# Altium project Wearable_ECG_OptionA.PrjPcb
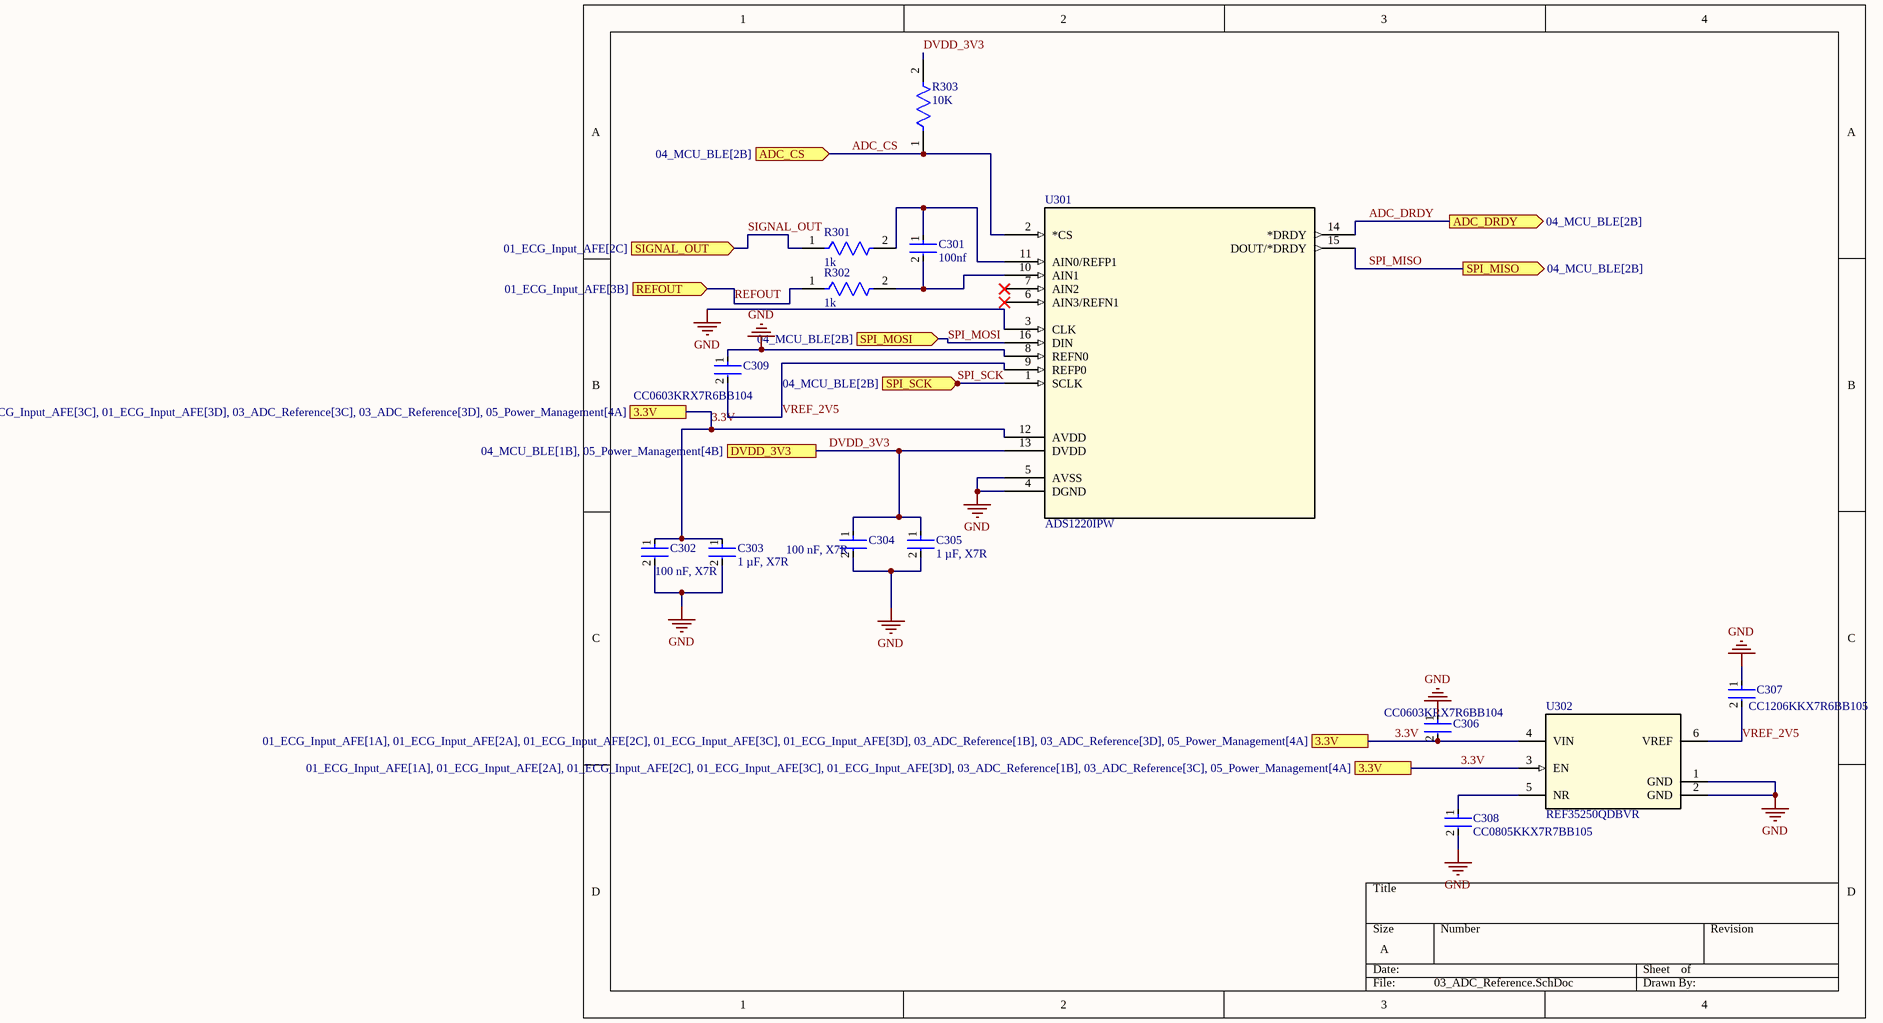
[diagram p0: 03_ADC_Reference.SchDoc]
6 sheets, 68 parts. Net scope: flat (ports and power ports of the same name join across sheets).
Board file: Wearable_ECG_230108U_230507R.PcbDoc
Sheets:
  02_DRL.SchDoc
  03_ADC_Reference.SchDoc
  04_MCU_BLE.SchDoc
  05_Power_Management.SchDoc
  06_System_Overview.SchDoc
  01_ECG_Input_AFE.SchDoc

## Sheet 02_DRL.SchDoc
size A; SheetNumber: 1; SheetTotal: 6

## Sheet 03_ADC_Reference.SchDoc
size A; SheetNumber: 2; SheetTotal: 6

### Parts
C301  100nf  [FP-CC0603-DA-MFG]
C302  100 nF, X7R  [FP-CC0603-DA-MFG]
C303  1 µF, X7R  [FP-CC0805-0_85-MFG]
C304  100 nF, X7R  [FP-CC0603-DA-MFG]
C305  1 µF, X7R  [FP-CC0805-0_85-MFG]
C306  CC0603KRX7R6BB104  [FP-CC0603-DA-MFG]
C307  CC1206KKX7R6BB105  [FP-CC1206-1_25-MFG]
C308  CC0805KKX7R7BB105  [FP-CC0805-0_85-MFG]
C309  CC0603KRX7R6BB104  [FP-CC0603-DA-MFG]
R301  1k  [FP-AC0603-IPC_B]
R302  1k  [FP-AC0603-IPC_B]
R303  10K  [FP-MCT0603-IPC_B]
U301  ADS1220IPW  [PW16]
U302  REF35250QDBVR  [DBV0006A-IPC_A]

### Ports
3.3V (see 01_ECG_Input_AFE[1A], 01_ECG_Input_AFE[2A], 01_ECG_Input_AFE[2C], 01_ECG_Input_AFE[3C], 01_ECG_Input_AFE[3D], 03_ADC_Reference[1B], 03_ADC_Reference[3C], 05_Power_Management[4A]), 3.3V (see 01_ECG_Input_AFE[1A], 01_ECG_Input_AFE[2A], 01_ECG_Input_AFE[2C], 01_ECG_Input_AFE[3C], 01_ECG_Input_AFE[3D], 03_ADC_Reference[1B], 03_ADC_Reference[3D], 05_Power_Management[4A]), 3.3V (see 01_ECG_Input_AFE[1A], 01_ECG_Input_AFE[2A], 01_ECG_Input_AFE[2C], 01_ECG_Input_AFE[3C], 01_ECG_Input_AFE[3D], 03_ADC_Reference[3C], 03_ADC_Reference[3D], 05_Power_Management[4A]), ADC_CS (in, see 04_MCU_BLE[2B]), ADC_DRDY (out, see 04_MCU_BLE[2B]), DVDD_3V3 (see 04_MCU_BLE[1B], 05_Power_Management[4B]), REFOUT (in, see 01_ECG_Input_AFE[3B]), SIGNAL_OUT (in, see 01_ECG_Input_AFE[2C]), SPI_MISO (out, see 04_MCU_BLE[2B]), SPI_MOSI (in, see 04_MCU_BLE[2B]), SPI_SCK (in, see 04_MCU_BLE[2B])

### Nets
GND: C302.2 C303.2 C304.2 C305.2 C306.1 C307.1 C308.2 C309.1 U301.3(CLK) U301.4(DGND) U301.5(AVSS) U301.8(REFN0) U302.1(GND) U302.2(GND)
3.3V: C302.1 C303.1 C306.2 U301.12(AVDD) U302.3(EN) U302.4(VIN) ; port 3.3V
ADC_CS: R303.1 U301.2(*CS) ; port ADC_CS
ADC_DRDY: U301.14(*DRDY) ; port ADC_DRDY
DVDD_3V3: C304.1 C305.1 R303.2 U301.13(DVDD) ; port DVDD_3V3
REFOUT: R302.1 ; port REFOUT
SIGNAL_OUT: R301.1 ; port SIGNAL_OUT
SPI_MISO: U301.15(DOUT/*DRDY) ; port SPI_MISO
SPI_MOSI: U301.16(DIN) ; port SPI_MOSI
SPI_SCK: U301.1(SCLK) ; port SPI_SCK
VREF_2V5: C307.2 C309.2 U301.9(REFP0) U302.6(VREF)
NetC301_1: C301.1 R301.2 U301.11(AIN0/REFP1)
NetC301_2: C301.2 R302.2 U301.10(AIN1)
NetC308_1: C308.1 U302.5(NR)

Not connected (* = marked no-connect by the designer): U301 6(AIN3/REFN1)* 7(AIN2)*

### Library data of the parts
C301 = CMP-03422-001228-1: CAP CER 0.1UF 10V X7R 0603, CC0603KRX7R6BB104; Manufacturer: YAGEO; Material: Ceramic; Tolerance: 0.1; Temperature Coefficient: 15%; Height: 0.9mm; RoHS: TRUE; Footprint Url: http://www.yageo.com/exep/pages/download/literatures/UPY-C_GEN_24.pdf; Octopart: https://octopart.com/cc0603krx7r6bb104-yageo-9291607; Device Class L1: Passive Components; Mouser Description: 0603 0.1 uF 10 V ±10 % Tolerance X7R SMT Multilayer Ceramic Capacitor; ComponentLink2URL: http://www.yageo.com/documents/recent/UPY-GPHC_X7R_6.3V-to-50V_18.pdf; Automotive: No; Voltage: 10 V; Capacitance: 100 nF; Device Class L3: Ceramic Capacitors; Category: Cap; Manufacturer Part Number: CC0603KRX7R6BB104; Temperature: -55°C to +125°C; ComponentLink2Description: Datasheet; Voltage Rating: 10 V; Device Class L2: Capacitors; Lead Free: Yes; Temperature Range High: +125°C; Temperature Range Low: -55°C; Digikey Description: CAP CER 0.1UF 10V X7R 0603; Package: CC0603-DA; Temperature Characteristic: X7R; Value: 100 nF
C302 = CMP-03422-001228-1: CAP CER 0.1UF 10V X7R 0603    CC0603KRX7R6BB104; Manufacturer: YAGEO; Material: Ceramic; Tolerance: 0.1; Capacitance: 100 nF; Temperature Coefficient: 15%; Value: 100 nF; Height: 0.9mm; RoHS: TRUE; Footprint Url: http://www.yageo.com/exep/pages/download/literatures/UPY-C_GEN_24.pdf; Octopart: https://octopart.com/cc0603krx7r6bb104-yageo-9291607; Device Class L1: Passive Components; Mouser Description: 0603 0.1 uF 10 V ±10 % Tolerance X7R SMT Multilayer Ceramic Capacitor; ComponentLink2URL: http://www.yageo.com/documents/recent/UPY-GPHC_X7R_6.3V-to-50V_18.pdf; Automotive: No; Voltage: 10 V; Device Class L3: Ceramic Capacitors; Category: Cap; Manufacturer Part Number: CC0603KRX7R6BB104; Temperature: -55°C to +125°C; ComponentLink2Description: Datasheet; Voltage Rating: 10 V; Device Class L2: Capacitors; Lead Free: Yes; Temperature Range High: +125°C; Temperature Range Low: -55°C; Digikey Description: CAP CER 0.1UF 10V X7R 0603; Package: CC0603-DA; Temperature Characteristic: X7R
C303 C305 = CMP-03422-000373-1: CC0805 1 uF X7R 10.00% 25 V, CC0805KFX7R8BB105; Manufacturer: Yageo; Voltage Rating: 25 V; Value: 1 uF; Tolerance: 0.1; Material: Ceramic; Category: Cap; Footprint Url: http://www.yageo.com/exep/pages/download/literatures/UPY-C_GEN_24.pdf; ComponentLink2Description: Datasheet; Temperature Characteristic: X7R; Temperature Range High: +85°C; Manufacturer Part Number: CC0805KFX7R8BB105; Mouser Description: CC Series 0805 1 uF 25 V ±10% Tolerance X7R Multilayer Ceramic Capacitor; Package: CC0805-0.85; Device Class L1: Passive Components; Automotive: No; RoHS: TRUE; Octopart: https://octopart.com/cc0805kfx7r8bb105-yageo-33242303; Capacitance: 1 uF; Device Class L2: Capacitors; Ipc Land Pattern Name: CAPC200125X85; Temperature Range Low: -30°C; Temperature: -30°C to +85°C; Height: 0.95mm; ComponentLink2URL: http://www.yageo.com/documents/recent/UPY-GPHC_Y5V_6.3V-to-50V_8.pdf; Device Class L3: Ceramic Capacitors; Lead Free: Yes
C304 = CMP-03422-001228-1: CAP CER 0.1UF 10V X7R 0603, CC0603KRX7R6BB104; Manufacturer: YAGEO; Material: Ceramic; Tolerance: 0.1; Capacitance: 100 nF; Temperature Coefficient: 15%; Value: 100 nF; Height: 0.9mm; RoHS: TRUE; Footprint Url: http://www.yageo.com/exep/pages/download/literatures/UPY-C_GEN_24.pdf; Octopart: https://octopart.com/cc0603krx7r6bb104-yageo-9291607; Device Class L1: Passive Components; Mouser Description: 0603 0.1 uF 10 V ±10 % Tolerance X7R SMT Multilayer Ceramic Capacitor; ComponentLink2URL: http://www.yageo.com/documents/recent/UPY-GPHC_X7R_6.3V-to-50V_18.pdf; Automotive: No; Voltage: 10 V; Device Class L3: Ceramic Capacitors; Category: Cap; Manufacturer Part Number: CC0603KRX7R6BB104; Temperature: -55°C to +125°C; ComponentLink2Description: Datasheet; Voltage Rating: 10 V; Device Class L2: Capacitors; Lead Free: Yes; Temperature Range High: +125°C; Temperature Range Low: -55°C; Digikey Description: CAP CER 0.1UF 10V X7R 0603; Package: CC0603-DA; Temperature Characteristic: X7R
C306 C309 = CMP-03422-001228-1: CAP CER 0.1UF 10V X7R 0603; Manufacturer: YAGEO; Material: Ceramic; Tolerance: 0.1; Capacitance: 100 nF; Temperature Coefficient: 15%; Value: 100 nF; Height: 0.9mm; RoHS: TRUE; Footprint Url: http://www.yageo.com/exep/pages/download/literatures/UPY-C_GEN_24.pdf; Octopart: https://octopart.com/cc0603krx7r6bb104-yageo-9291607; Device Class L1: Passive Components; Mouser Description: 0603 0.1 uF 10 V ±10 % Tolerance X7R SMT Multilayer Ceramic Capacitor; ComponentLink2URL: http://www.yageo.com/documents/recent/UPY-GPHC_X7R_6.3V-to-50V_18.pdf; Automotive: No; Voltage: 10 V; Device Class L3: Ceramic Capacitors; Category: Cap; Manufacturer Part Number: CC0603KRX7R6BB104; Temperature: -55°C to +125°C; ComponentLink2Description: Datasheet; Voltage Rating: 10 V; Device Class L2: Capacitors; Lead Free: Yes; Temperature Range High: +125°C; Temperature Range Low: -55°C; Digikey Description: CAP CER 0.1UF 10V X7R 0603; Package: CC0603-DA; Temperature Characteristic: X7R
C307 = CMP-03422-001171-1: CAP CER 1UF 10V X7R 1206; Manufacturer: Yageo; Material: Ceramic; Tolerance: 0.1; Automotive Grade: NA; Temperature Coefficient: 15%; Category: Cap; Package: CC1206-1.25; Device Class L3: Ceramic Capacitors; Footprint Url: http://www.yageo.com/exep/pages/download/literatures/UPY-C_GEN_24.pdf; Octopart: https://octopart.com/cc1206kkx7r6bb105-yageo-21769912; Temperature Range High: +125°C; Lead Free: Yes; Capacitance: 1 uF; Voltage Rating: 10 V; ComponentLink2Description: Datasheet; ComponentLink2URL: http://www.yageo.com/documents/recent/UPY-NP0X7R_HV_1KV-to-3KV_11.pdf; Height: 1.45mm; Device Class L1: Passive Components; Temperature Range Low: -55°C; Value: 1 uF; Device Class L2: Capacitors; Digikey Description: CAP CER 1UF 10V X7R 1206; RoHS: TRUE; Mouser Description: Multilayer Ceramic Capacitors MLCC - SMD/SMT 1.0uF 10V X7R 10%; Temperature Characteristic: X7R; Automotive: No; Temperature: -55°C to +125°C; Manufacturer Part Number: CC1206KKX7R6BB105
C308 = CMP-03422-000001-1: CAP CER 1UF 16V X7R 0805; Manufacturer: Yageo; Material: Ceramic; Tolerance: 0.1; Voltage Rating: 16 V; Category: Cap; Capacitance: 1 uF; ComponentLink2Description: Datasheet; Automotive: No; Temperature Range High: +85°C; RoHS: TRUE; Footprint Url: http://www.yageo.com/exep/pages/download/literatures/UPY-C_GEN_24.pdf; Mouser Description: Multilayer Ceramic Capacitors MLCC - SMD/SMT 1.0uF 16V X7R 10%; Height: 0.95mm; Ipc Land Pattern Name: CAPC200125X85; Temperature: -30°C to +85°C; Lead Free: Yes; Value: 1 uF; Temperature Characteristic: X7R; Package: CC0805-0.85; Temperature Range Low: -30°C; Device Class L1: Passive Components; Device Class L3: Ceramic Capacitors; Octopart: https://octopart.com/cc0805kkx7r7bb105-yageo-8376555; Manufacturer Part Number: CC0805KKX7R7BB105; ComponentLink2URL: http://www.yageo.com/documents/recent/UPY-GPHC_Y5V_6.3V-to-50V_8.pdf; Device Class L2: Capacitors; Digikey Description: CAP CER 1UF 16V X7R 0805
R301 R302 = CMP-03412-047577-1: RES 1kΩ 1.00% 0.2W 0603, AC0603FR-7W1KL
R303 = CMP-02407-001090-1: RES SMD 10K OHM 1% 1/8W 0603, MCT0603HC1002FP500
U301 = ADS1220IPW: 24-bit, 2-kSPS, four-channel, low-power, delta-sigma ADC with PGA, VREF, SPI and two IDACs 16-TSSOP -40 to 125; Manufacturer_Name: Texas Instruments; Copyright: Copyright (C) 2026 Ultra Librarian. All rights reserved.; Manufacturer_Part_Number: ADS1220IPW; Datasheet: https://www.ti.com/lit/gpn/ads1220; RefDes: RefDes; Type: Type
U302 = REF35250QDBVR: 650-nA quiescent current, 12-ppm/Â°C drift, ultra-low-power precision voltage reference 6-SOT-23 -40 to 125; Manufacturer_Name: Texas Instruments; TYPE: TYPE; RefDes: RefDes; Copyright: Copyright (C) 2026 Ultra Librarian. All rights reserved.; Manufacturer_Part_Number: REF35250QDBVR; Datasheet: https://www.ti.com/lit/gpn/ref35

## Sheet 04_MCU_BLE.SchDoc
size A; SheetNumber: 3; SheetTotal: 6
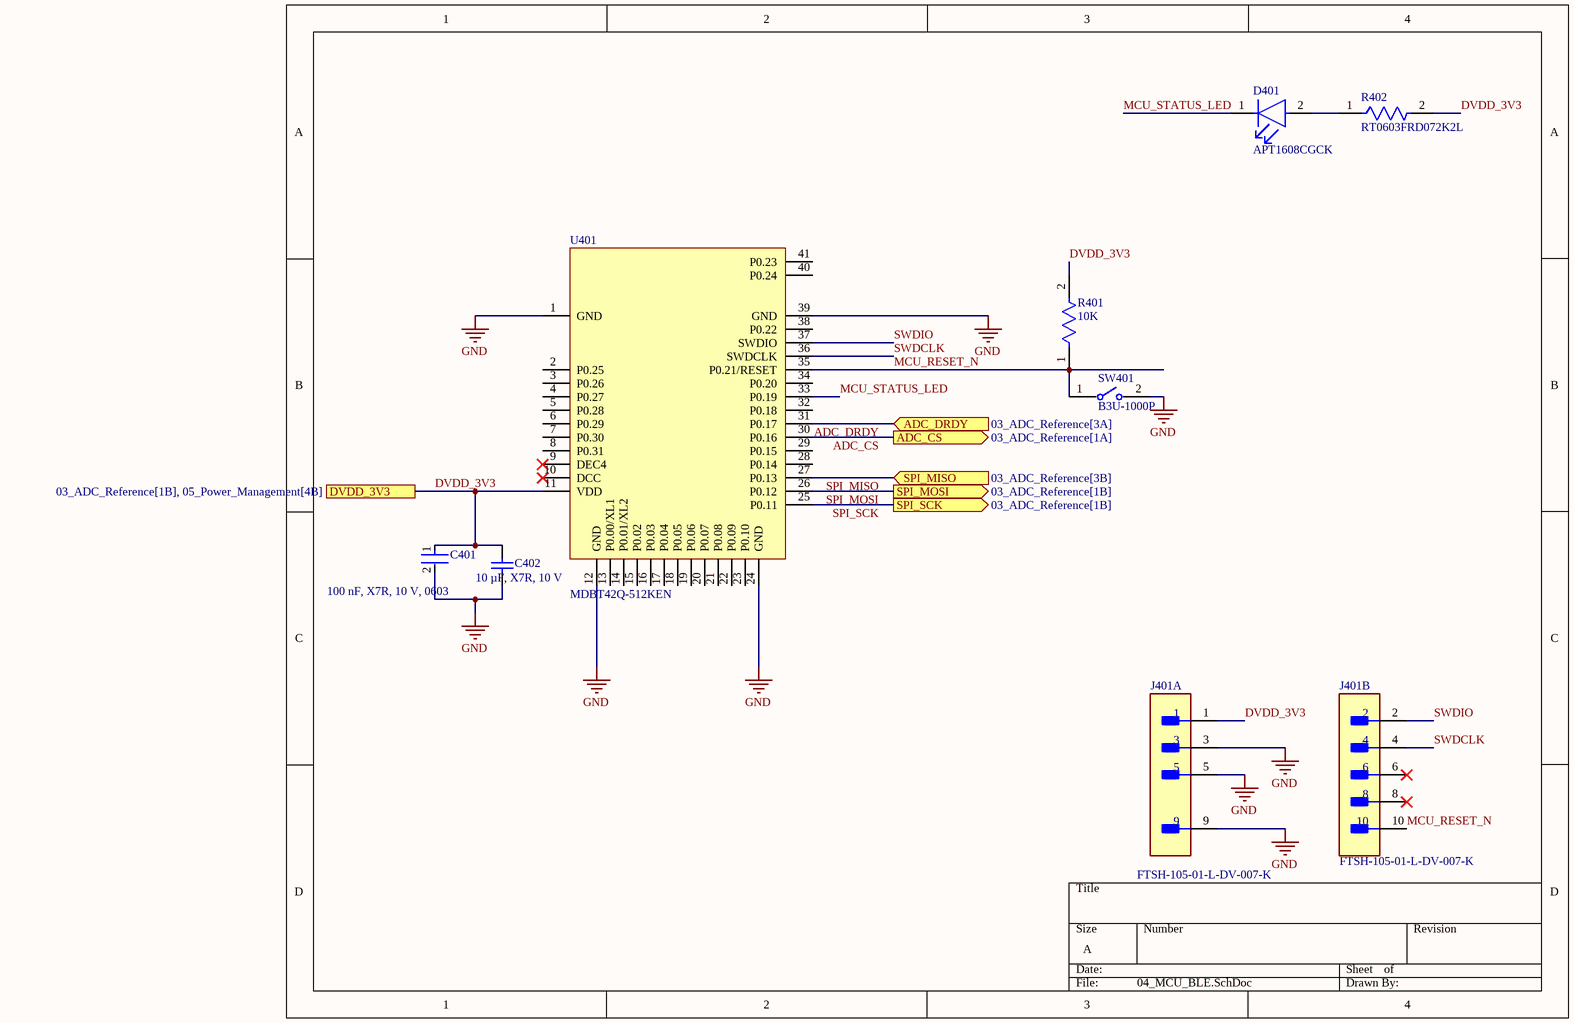
[diagram p1: 04_MCU_BLE.SchDoc]

### Parts
C401  100 nF, X7R, 10 V, 0603  [FP-CC0603-DA-MFG]
C402  10 µF, X7R, 10 V  [CAPC1206(3216)190_N]
D401  APT1608CGCK  [FP-APT1608CGCK-MFG]
J401  FTSH-105-01-L-DV-007-K  [FP-FTSH-105-01-L-DV-007-K-MFG]  (parts A,B of 2)
R401  10K  [FP-AC0603-IPC_C]
R402  RT0603FRD072K2L  [FP-RT0603-MFG]
SW401  B3U-1000P  [FP-B3U-1000P-MFG]
U401  MDBT42Q-512KEN  [MDBT42Q]

### Ports
ADC_CS (out, see 03_ADC_Reference[1A]), ADC_DRDY (in, see 03_ADC_Reference[3A]), DVDD_3V3 (see 03_ADC_Reference[1B], 05_Power_Management[4B]), SPI_MISO (in, see 03_ADC_Reference[3B]), SPI_MOSI (out, see 03_ADC_Reference[1B]), SPI_SCK (out, see 03_ADC_Reference[1B])

### Nets
GND: C401.2 C402.1 J401.3 J401.5 J401.9 SW401.2 U401.1(GND) U401.12(GND) U401.24(GND) U401.39(GND)
ADC_CS: U401.30(P0.16) ; port ADC_CS
ADC_DRDY: U401.31(P0.17) ; port ADC_DRDY
DVDD_3V3: C401.1 C402.2 J401.1 R401.2 R402.2 U401.11(VDD) ; port DVDD_3V3
MCU_RESET_N: J401.10 R401.1 SW401.1 U401.35(P0.21/RESET)
MCU_STATUS_LED: D401.1(C) U401.33(P0.19)
SPI_MISO: U401.27(P0.13) ; port SPI_MISO
SPI_MOSI: U401.26(P0.12) ; port SPI_MOSI
SPI_SCK: U401.25(P0.11) ; port SPI_SCK
SWDCLK: J401.4 U401.36(SWDCLK)
SWDIO: J401.2 U401.37(SWDIO)
NetD401_2: D401.2(A) R402.1

Not connected (* = marked no-connect by the designer): J401 6* 8*; U401 2(P0.25) 3(P0.26) 4(P0.27) 5(P0.28) 6(P0.29) 7(P0.30) 8(P0.31) 9(DEC4)* 10(DCC)* 13(P0.00/XL1) 14(P0.01/XL2) 15(P0.02) 16(P0.03) 17(P0.04) 18(P0.05) 19(P0.06) 20(P0.07) 21(P0.08) 22(P0.09) 23(P0.10) 28(P0.14) 29(P0.15) 32(P0.18) 34(P0.20) 38(P0.22) 40(P0.24) 41(P0.23)

### Library data of the parts
C401 = CMP-03422-001228-1: CAP CER 0.1UF 10V X7R 0603; Manufacturer Part Number: CC0603KRX7R6BB104; Manufacturer: YAGEO; Material: Ceramic; Tolerance: 0.1; Capacitance: 100 nF; Temperature Coefficient: 15%; Value: 100 nF; Height: 0.9mm; RoHS: TRUE; Footprint Url: http://www.yageo.com/exep/pages/download/literatures/UPY-C_GEN_24.pdf; Octopart: https://octopart.com/cc0603krx7r6bb104-yageo-9291607; Device Class L1: Passive Components; Mouser Description: 0603 0.1 uF 10 V ±10 % Tolerance X7R SMT Multilayer Ceramic Capacitor; ComponentLink2URL: http://www.yageo.com/documents/recent/UPY-GPHC_X7R_6.3V-to-50V_18.pdf; Automotive: No; Voltage: 10 V; Device Class L3: Ceramic Capacitors; Category: Cap; Temperature: -55°C to +125°C; ComponentLink2Description: Datasheet; Voltage Rating: 10 V; Device Class L2: Capacitors; Lead Free: Yes; Temperature Range High: +125°C; Temperature Range Low: -55°C; Digikey Description: CAP CER 0.1UF 10V X7R 0603; Package: CC0603-DA; Temperature Characteristic: X7R
C402 = CMP-1037-04966-1: CAP 10uF 10V ±5% 1206 (3216 Metric) Thickness 1.9mm SMD; Case-Metric: 3216; Case-EIA: 1206; Tolerance: Â±5%; Max Thickness: 1.9 mm; Value: 10uF; Rated Voltage: 10 V; Technology: SMT
D401 = CMP-44529-000032-1: LED GREEN CLEAR CHIP SMD; Luminous Intensity: 50mcd; Voltage: 3V; Forward Voltage: 2.1V; Forward Current: 20mA; Dominant Wavelength: 570nm; Power Rating: 75mW; Number of LEDs: 1; Viewing Angle: 120°; Number of Pins: 2; Packaging: Tape and Reel; Min Operating Temperature: -40°C; Length: 1.6mm; Width: 0.8mm; Mount: Surface Mount; Case/Package: 0603; Lead Free: Lead Free; Lens Color: Clear; Lens Style: Clear; Illumination Color: Green; Case Code (Imperial): 0603; Max Operating Temperature: 85°C; Height: 0.75mm; Case Code (Metric): 1608; Color: Green; Package Quantity: 2000; Test Current: 20mA
J401 = CMP-02766-000093-1: CONN HEADER SMD 10POS 1.27MM; Manufacturer: Samtec; Number Of Contacts: 9; Standoff Height: 0.2mm; Current Rating: 3.4A; Conn Orientation: Vertical; Conn Gender: Male; Device Class L3: unset; Manufacturer Part Number: FTSH-105-01-L-DV-007-K; Mouser Description: Conn Unshrouded Header HDR 10 POS 1.27mm Solder ST SMD Tube; Height: 6.38mm; RoHS: TRUE; Number Of Rows: 2; Footprint Url: http://suddendocs.samtec.com/prints/ftsh-1xx-xx-xxx-dv-xxx-footprint.pdf; Lead Free: Yes; Package: 0; Category: Conn; ComponentLink2URL: http://suddendocs.samtec.com/catalog_english/ftsh_smt.pdf; Automotive: No; ComponentLink2Description: Datasheet; Device Class L1: Connectors; Temperature: -55°C to +125°C; Digikey Description: CONN HEADER SMD 10POS 1.27MM; Device Class L2: Headers and Wire Housings; Temperature Range High: +125°C; Octopart: https://octopart.com/ftsh-105-01-l-dv-007-k-samtec-53647300; Contact Material: Gold,Nickel; Temperature Range Low: -55°C; Pitch: 1.27mm
R401 = CMP-03412-008483-2: RES 10KΩ 1.00% 0.1W 0603, AC0603FR-1310KL; Resistance: 10kR; Tolerance: 1%; RoHS Compliant: Yes; Lead Free: Lead Free; Case/Package: 0603
R402 = CMP-03412-026926-1: RES SMD 2.2K OHM 1% 1/10W 0603; Manufacturer: Yageo; Resistance: 2.2KΩ; Tolerance: 0.01; Power Rating: 0.1W; Voltage Rating: 75V; Value: 2.2KΩ; Temperature Coefficient: 25 ppm/°C; Footprint Url: http://www.yageo.com/exep/pages/download/literatures/PYu-R_Mount_10.pdf; ComponentLink2URL: http://www.yageo.com/documents/recent/PYu-RT_1-to-0.01_RoHS_L_9.pdf; Package: RT0603; Temperature: -55°C to +155°C; ComponentLink2Description: Datasheet; Device Class L2: Resistors; Digikey Description: RES SMD 2.2K OHM 1% 1/10W 0603; Composition: Thin Film; Temperature Range High: +155°C; Automotive: No; Temperature Range Low: -55°C; Manufacturer Part Number: RT0603FRD072K2L; Series: RT; RoHS: TRUE; Octopart: https://octopart.com/rt0603frd072k2l-yageo-71395345; Device Class L1: Passive Components; Ipc Land Pattern Name: RESC16080X45; Lead Free: Yes; Height: 0.55mm; Device Class L3: Chip SMD Resistors; Category: Res
SW401 = CMP-2100-03586-2: SWITCH TACTILE SPST-NO 0.05A 12V; Contact Resistance: 100mR; Operating Force: 1.5N; Max Current Rating: 50mA; Switch Travel: 0.15mm; Actuator Type: Standard; Mechanical Life: 200000Cycles; Ratings: Dust Proof; Illumination Type: Non-Illuminated; Throw Configuration: SPST; Actuator Length: 0.4mm; Switch Function: Off-Mom; Height: 1.2mm; Width: 3mm; Weight: 0.000776oz; Contact Material: Silver; Max Voltage Rating (DC): 12V; Insulation Resistance: 100MR; Lead Free: Lead Free; Current Rating: 50mA; Termination: SMD/SMT; Length: 4mm; Voltage Rating (DC): 12V; Contact Current Rating: 50mA; Orientation: Straight; Depth: 2.5mm; Max Operating Temperature: 70°C; Packaging: Tape and Reel; Min Operating Temperature: -25°C; Package Quantity: 1; Mount: Surface Mount; Electrical Life: 200000Cycles
U401 = MDBT42Q

## Sheet 05_Power_Management.SchDoc
size A; SheetNumber: 4; SheetTotal: 6
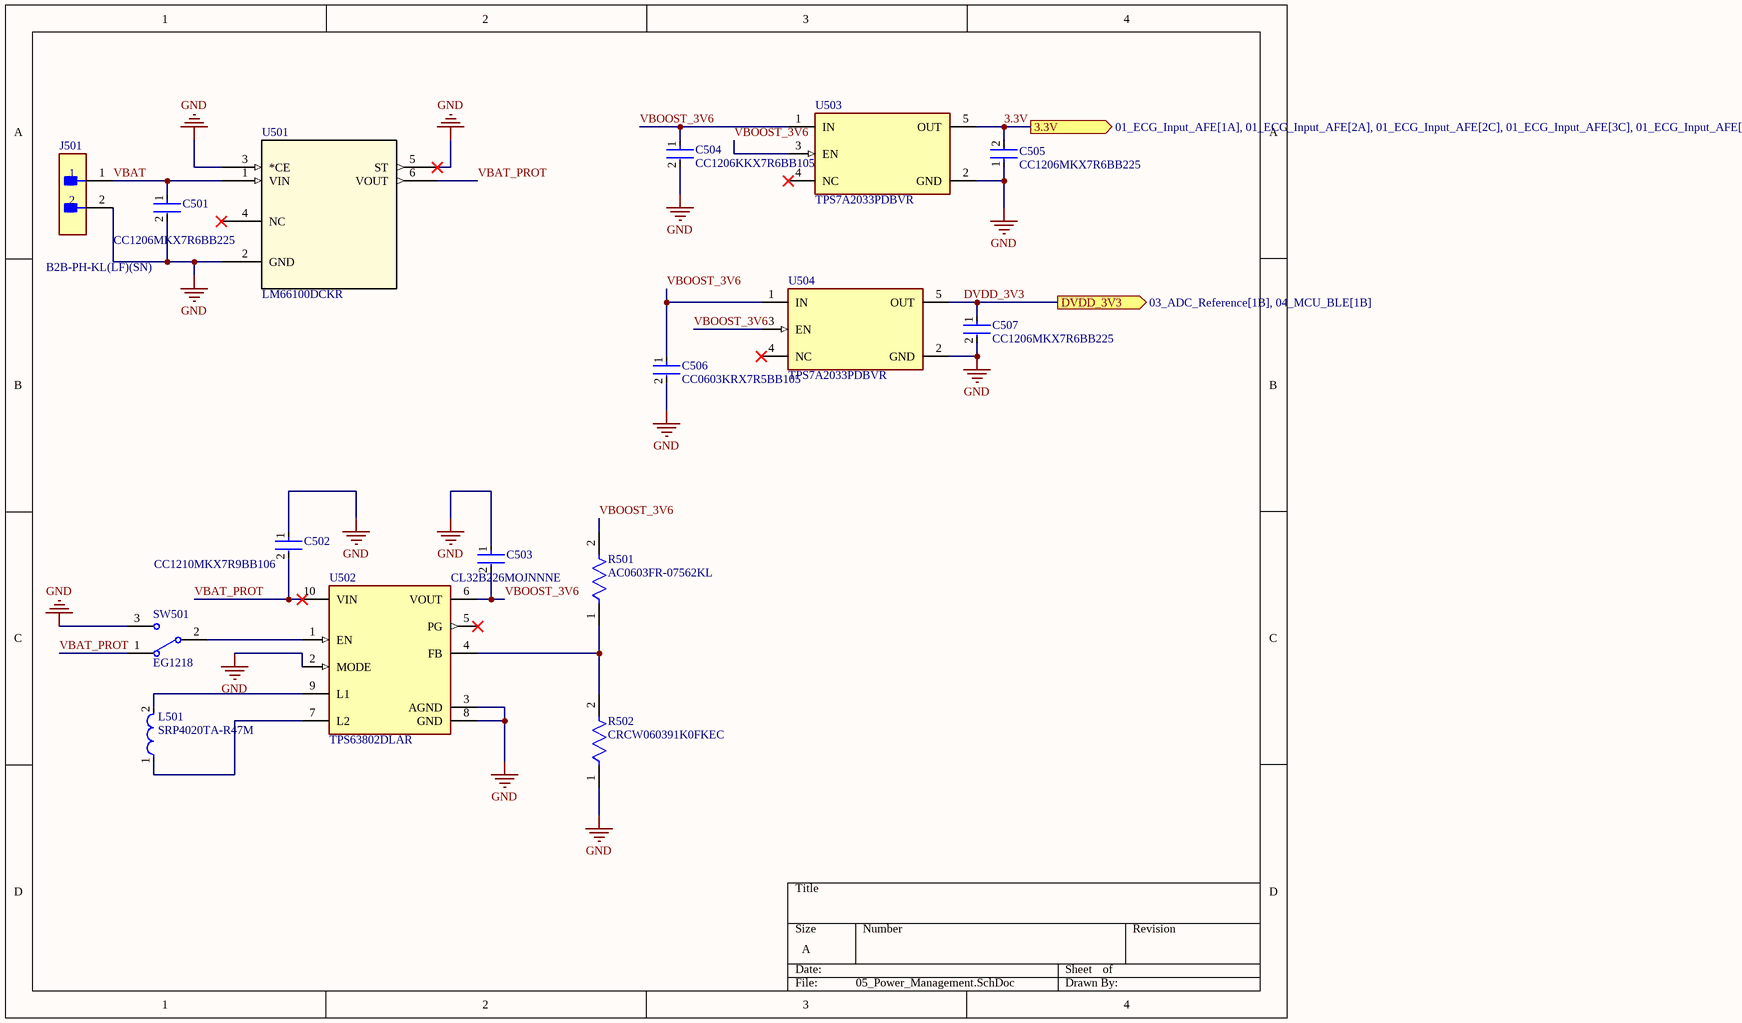
[diagram p2: 05_Power_Management.SchDoc]

### Parts
C501  CC1206MKX7R6BB225  [FP-CC1206-1_25-MFG]
C502  CC1210MKX7R9BB106  [FP-CC1210-GD-MFG]
C503  CL32B226MOJNNNE  [FP-CL32-IPC_A]
C504  CC1206KKX7R6BB105  [FP-CC1206-1_25-MFG]
C505  CC1206MKX7R6BB225  [FP-CC1206-1_25-MFG]
C506  CC0603KRX7R5BB105  [FP-CC0603-DA-MFG]
C507  CC1206MKX7R6BB225  [FP-CC1206-1_25-MFG]
J501  B2B-PH-KL(LF)(SN)  [FP-B2B-PH-KL_LF_SN-MFG]
L501  SRP4020TA-R47M  [FP-SRP4020TA-MFG]
R501  AC0603FR-07562KL  [FP-AC0603-MFG]
R502  CRCW060391K0FKEC  [FP-CRCW0603-e3-MFG]
SW501  EG1218  [ESWI-EG1218_V]
U501  LM66100DCKR  [DCK6_TEX]
U502  TPS63802DLAR  [FP-DLA0010A-MFG]
U503  TPS7A2033PDBVR  [FP-DBV0005A-MFG]
U504  TPS7A2033PDBVR  [FP-DBV0005A-MFG]

### Ports
3.3V (out, see 01_ECG_Input_AFE[1A], 01_ECG_Input_AFE[2A], 01_ECG_Input_AFE[2C], 01_ECG_Input_AFE[3C], 01_ECG_Input_AFE[3D], 03_ADC_Reference[1B], 03_ADC_Reference[3C], 03_ADC_Reference[3D]), DVDD_3V3 (out, see 03_ADC_Reference[1B], 04_MCU_BLE[1B])

### Nets
GND: C501.2 C502.1 C503.1 C504.2 C505.1 C506.2 C507.2 J501.2 R502.1 SW501.3 U501.2(GND) U501.3(*CE) U501.5(ST) U502.2(MODE) U502.3(AGND) U502.8(GND) U503.2(GND) U504.2(GND)
3.3V: C505.2 U503.5(OUT) ; port 3.3V
DVDD_3V3: C507.1 U504.5(OUT) ; port DVDD_3V3
VBAT: C501.1 J501.1 U501.1(VIN)
VBAT_PROT: C502.2 SW501.1 U501.6(VOUT) U502.10(VIN)
VBOOST_3V6: C503.2 C504.1 C506.1 R501.2 U502.6(VOUT) U503.1(IN) U503.3(EN) U504.1(IN) U504.3(EN)
NetL501_1: L501.1 U502.7(L2)
NetL501_2: L501.2 U502.9(L1)
NetR501_1: R501.1 R502.2 U502.4(FB)
NetSW501_2: SW501.2(COM) U502.1(EN)

Not connected (* = marked no-connect by the designer): U501 4(NC)*; U502 5(PG)*; U503 4(NC)*; U504 4(NC)*

### Library data of the parts
C501 C505 C507 = CMP-03422-000380-2: CAP CER 2.2UF 10V X7R 1206; Manufacturer: Yageo; Temperature Coefficient: 15%; Automotive Grade: NA; Tolerance: 0.2; Material: Ceramic; Lead Free: Yes; Temperature Characteristic: X7R; Footprint Url: http://www.yageo.com/exep/pages/download/literatures/UPY-C_GEN_24.pdf; Octopart: https://octopart.com/cc1206mkx7r6bb225-yageo-57080790; Temperature: -55°C to +125°C; Voltage Rating: 10 V; ComponentLink2Description: Datasheet; Device Class L3: Ceramic Capacitors; Manufacturer Part Number: CC1206MKX7R6BB225; Automotive: No; Value: 2.2 uF; Digikey Description: CAP CER 2.2UF 10V X7R 1206; Package: CC1206-1.25; Device Class L2: Capacitors; Category: Cap; Device Class L1: Passive Components; RoHS: TRUE; Height: 1.45mm; ComponentLink2URL: http://www.yageo.com/documents/recent/UPY-NP0X7R_HV_1KV-to-3KV_11.pdf; Capacitance: 2.2 uF; Temperature Range High: +125°C; Temperature Range Low: -55°C
C502 = CMP-03422-001447-1: CAP CER 10UF 50V X7R 1210; Tolerance: 20%; Case/Package: 1210; Max Operating Temperature: 125°C; Case Code (Imperial): 1210; Voltage Rating: 50V; Mount: Surface Mount; Packaging: Tape and Reel; Min Operating Temperature: -55°C; Case Code (Metric): 3225; Capacitance: 10uF; RoHS Compliant: Yes
C503 = CMP-13271-003818-1: Cap Ceramic 22uF 16V X7R ±20% SMD 1210 +125°C Embossed T/R; Mount: Surface Mount; Case/Package: 1210; Case Code (Imperial): 1210; Depth: 2.5mm; Packaging: Tape and Reel; Case Code (Metric): 3225; Package Quantity: 1; Min Operating Temperature: -55°C; Dielectric: X7R; Height: 2.5mm; Length: 3.2mm; Max Operating Temperature: 125°C; Thickness: 0.106inch; Capacitance: 22uF; Width: 0.098inch; Tolerance: 20%; Voltage Rating: 16V; Radiation Hardening: No
C504 = CMP-03422-001171-1: as C307 on sheet 03_ADC_Reference; Category: Cap; Package: CC1206-1.25; Device Class L3: Ceramic Capacitors; Footprint Url: http://www.yageo.com/exep/pages/download/literatures/UPY-C_GEN_24.pdf; Octopart: https://octopart.com/cc1206kkx7r6bb105-yageo-21769912; Temperature Range High: +125°C; Lead Free: Yes; Capacitance: 1 uF; Voltage Rating: 10 V; ComponentLink2Description: Datasheet; ComponentLink2URL: http://www.yageo.com/documents/recent/UPY-NP0X7R_HV_1KV-to-3KV_11.pdf; Height: 1.45mm; Device Class L1: Passive Components; Temperature Range Low: -55°C; Value: 1 uF; Device Class L2: Capacitors; Digikey Description: CAP CER 1UF 10V X7R 1206; RoHS: TRUE; Mouser Description: Multilayer Ceramic Capacitors MLCC - SMD/SMT 1.0uF 10V X7R 10%; Temperature Characteristic: X7R; Automotive: No; Temperature: -55°C to +125°C; Manufacturer Part Number: CC1206KKX7R6BB105
C506 = CMP-03422-000406-1: 0603 1 uF 6.3 V ±10 % Tolerance X7R SMT Multilayer Ceramic Capacitor; Manufacturer: YAGEO; Tolerance: 0.1; Temperature Coefficient: 15%; Capacitance: 1 uF; Value: 1 uF; Voltage Rating: 6.3 V; Temperature Range High: +125°C; Octopart: https://octopart.com/cc0603krx7r5bb105-yageo-11543596; Device Class L2: Capacitors; Package: CC0603-DA; RoHS: TRUE; Digikey Description: 0603 1 uF 6.3 V ±10 % Tolerance X7R SMT Multilayer Ceramic Capacitor; Category: Cap; ComponentLink2URL: http://www.yageo.com/documents/recent/UPY-GPHC_X7R_6.3V-to-50V_18.pdf; Lead Free: Yes; Material: Ceramic; Mouser Description: 0603 1 uF 6.3 V ±10 % Tolerance X7R SMT Multilayer Ceramic Capacitor; Device Class L1: Passive Components; Device Class L3: Ceramic Capacitors; ComponentLink2Description: Datasheet; Automotive: No; Height: 0.9mm; Manufacturer Part Number: CC0603KRX7R5BB105; Voltage: 6.3 V; Temperature: -55°C to +125°C; Temperature Characteristic: X7R; Footprint Url: http://www.yageo.com/exep/pages/download/literatures/UPY-C_GEN_24.pdf; Temperature Range Low: -55°C
J501 = CMP-17439-000682-1: Connector Header, PH Series, 2 Position, 2.00mm, Shrouded Through Hole, Press-Fit, 100V, 32-24 AWG, Solder, Gray; Number of Positions: 2; Pitch: 2mm; Voltage Rating: 100V; Contact Finish - Mating: TIN; Number of Rows: 1; Mount: Through Hole; Flammability Rating: UL94 V-0; Fastening Type: Detent; Contact Shape: Square; Insulation Material: Nylon; Insulation Color: Grey; Contact Material: Brass; Contact Type: Male Pin; Lead Free: Lead Free; Connector Type: Header; Series: PH; Packaging: Bulk; Termination: Press-Fit
L501 = CMP-00059-47300346-1: SRP4020TA-R47M Inductor Power Shielded Wirewound 470nH 20% 100KHz 10Q-Factor Carbonyl Powder 8A 14mOhm DCR 1616 Automotive T/R; DC Resistance (DCR): 14mΩ; Self Resonant Frequency: 120MHz; Q Factor: 10; Max DC Current: 12A; Length: 4.445mm; Weight: 149.997327mg; Max Operating Temperature: 150°C; Case/Package: SMD/SMT; Inductance: 470nH; Current Rating: 8A; Inductance Tolerance: 20%; REACH SVHC: No SVHC; Test Frequency: 100kHz; Schedule B: 8504500000, 8504500000; Packaging: Tape & Reel (TR); Ratings: AEC-Q200; Depth: 4.06mm; Height: 1.8mm; RoHS: Compliant; Core Material: Carbonyl Powder; Height - Seated (Max): 2.0066mm; Series Resistance: 14mΩ; Composition: Wirewound; NexarPartId: 47300346; Number of Pins: 2; Min Operating Temperature: -55°C; Tolerance: 20%; Mount: Surface Mount; Saturation Current: 12A; Shielding: Shielded; RMS Current (Irms): 8A; Width: 4.06mm; Termination: SMD/SMT
R501 = CMP-03412-029819-2: RES 562KΩ 1.00% 0.1W 0603; Tolerance: 1%; Max Power Dissipation: 100mW; Temperature Coefficient: 100ppm/°C; Voltage Rating: 50V; Resistance: 562kR; Number of Terminations: 2; Series: AC; RoHS Compliant: Yes; Length: 0.063inch; Case Code (Metric): 1608; Width: 0.8mm; Features: Moisture Resistant; Termination: SMD/SMT; Max Operating Temperature: 155°C; Weight: 7.1E-05oz; Case/Package: 0603; Min Operating Temperature: -55°C; Height: 0.022inch; Packaging: Tape and Reel; Case Code (Imperial): 0603; Power Rating: 100mW; Resistor Type: Thick Film
R502 = CMP-02407-006807-1: RES Thick Film, 91kΩ, 1%, 0.1W, 100ppm/°C, 0603; Resistance: 91kR; Max Power Dissipation: 100mW; Max Operating Temperature: 155°C; Height: 0.02inch; Features: Automotive AEC-Q200; Temperature Coefficient: 100ppm/°C; Min Operating Temperature: -55°C; Tolerance: 1%; Package Quantity: 20000; Packaging: Tape and Reel; Number of Terminations: 2; Width: 0.033inch; Length: 0.061inch; Composition: Thick Film; Lead Free: Lead Free; Case/Package: 0603
SW501 = CMP-1696-00002-1: Slide Switch, 500 V, -20 to 70 degC, 3-Pin THD, RoHS; Case\Package: SOT-23-5; Output Current: 150 mA; Nominal Output Voltage: 3.3 V; Max Power Dissipation: 250 mW; Min Input Voltage: 4.3 V; Outputs: 1; Max Input Voltage: 8 V; Dropout Voltage: 300 mV; PackageDescription: 3-Pin Through Hole Device, Body 11.6 x 4 mm, Pitch 2.5 mm; ComponentLink1URL: http://www.e-switch.ch/en/; RoHSCompliant: true; Length: 3 mm; ComponentLink1Description: Manufacturer URL; Power Rating: 250 mW; Mount: Surface Mount; Max Operating Temperature: 85 degC; REACH SVHC: No SVHC; Radiation Hardening: No; Height: 1.3 mm; Pins: 5; Max Ouput Current: 150 mA; Output Voltage: 3.3 V; Width: 1.8 mm; Package Quantity: 3000; ComponentLink2URL: https://www.e-switch.com/system/asset/product_line/data_sheet/119/EG.pdf; Min Operating Temperature: -40 degC; ComponentLink2Description: Datasheet; DatasheetVersion: Oct-15; PackageReference: EG1218; Packaging: Tape and Reel
U501 = LM66100DCKR: 1.5-V to 5.5-V, 1.5-A, 0.5-ÂµA IQ ideal diode with integrated FET 6-SC70 -40 to 125; Manufacturer_Name: Texas Instruments; Copyright: Copyright (C) 2025 Ultra Librarian. All rights reserved.; Manufacturer_Part_Number: LM66100DCKR; RefDes: RefDes; Type: Type
U502 = CMP-04918-000005-1: IC POWER MANAGEMENT; Manufacturer: Texas Instruments; Nominal Supply Current: 11uA; Max Junction Temp: +125°C; Max Supply Voltage: 5.5V; Switching Topology: Buck-Boost; Min Supply Voltage: 1.3V; Output Current: 2A; Output Voltage: 1.8-5.2V; Number Of Outputs: 1; Switching Frequency: 1.4/1.6/2.1MHz; Standoff Height: 0mm; Max Duty Cycle: 100%; Output Type: AdjustableProgrammable; Manufacturer Part Number: TPS63802DLAR; ComponentLink2URL: https://www.ti.com/lit/ds/symlink/tps63802.pdf; Digikey Description: IC POWER MANAGEMENT; Octopart: https://octopart.com/tps63802dlar-texas+instruments-97359678; Height: 1mm; Temperature: -40°C to +125°C; Device Class L3: Voltage Regulators - Switching; Lead Free: Yes; Category: IC; Mouser Description: 2-A, high-efficient, 11-µA quiescent current buck-boost converter in QFN/DFN package 10-VSON-HR -40 to 125; ComponentLink2Description: Datasheet; Temperature Range Low: -40°C; Temperature Range High: +125°C; Automotive: No; Device Class L2: Power Management ICs; RoHS: TRUE; Device Class L1: Integrated Circuits (ICs); Package: DLA0010A
U503 U504 = CMP-04917-000300-1: IC REG LINEAR 3.3V 300MA SOT23-5; RoHS Compliant: Yes

## Sheet 06_System_Overview.SchDoc
size A; SheetNumber: 6; SheetTotal: 6

## Sheet 01_ECG_Input_AFE.SchDoc
size A; SheetNumber: 6; SheetTotal: 6
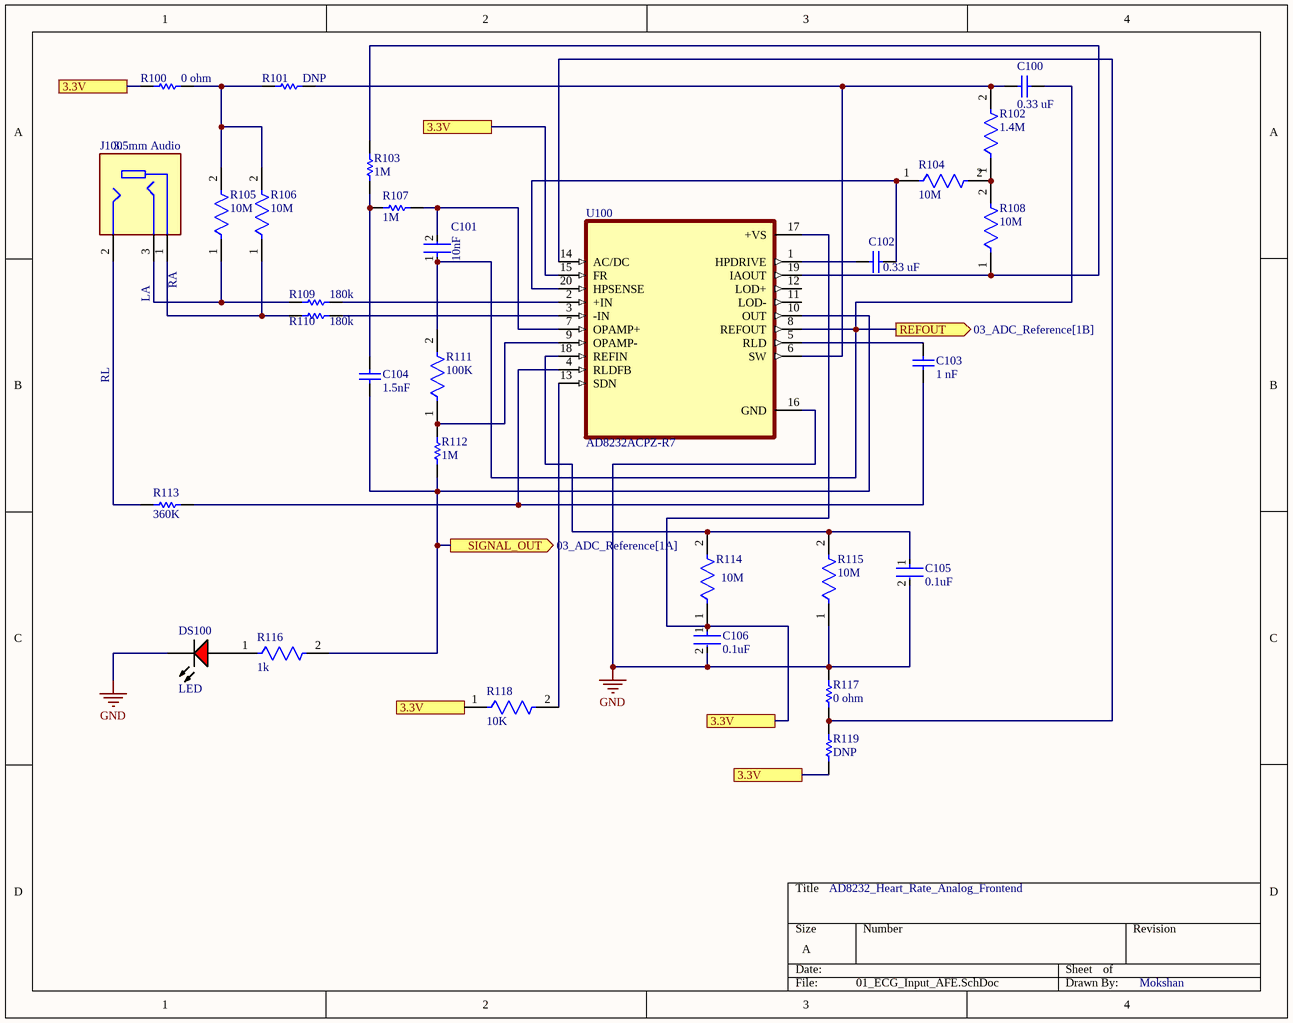
[diagram p3: 01_ECG_Input_AFE.SchDoc]

### Parts
C100  0.33 uF  [CAPC2013X135X45ML10T25]
C101  10nF  [FP-0805-L_2_01_0_2-W_1_25-IPC_A]
C102  0.33 uF  [CAPC2013X135X45ML10T25]
C103  1 nF  [CAPC0805(2012)100_M]
C104  1.5nF  [CAPC2013X140X50ML20T25]
C105  0.1uF  [FP-CC0805-0_85-MFG]
C106  0.1uF  [FP-CC0805-0_85-MFG]
DS100  LED  [LUMX-SML-LX1206IC_V]
J100  3.5mm Audio  [CUI_SJ1-3523N]
R100  0 ohm  [RESC1608X55X25ML10T15]
R101  DNP  [RESC1608X55X25ML10T15]
R102  1.4M  [FP-ESR10-MFG]
R103  1M  [RESC0805(2012)_L]
R104  10M  [FP-CRCW0805-e3-IPC_C]
R105  10M  [FP-CRCW0805-e3-IPC_C]
R106  10M  [FP-CRCW0805-e3-IPC_C]
R107  1M  [RESC0805(2012)_L]
R108  10M  [FP-CRCW0805-e3-IPC_C]
R109  180k  [RESC2013X60X30NL20T20]
R110  180k  [RESC2013X60X30NL20T20]
R111  100K  [FP-CRGCQ0805-IPC_C]
R112  1M  [RESC0805(2012)_L]
R113  360K  [RESC2013X60X30NL20T20]
R114  10M  [FP-CRCW0805-e3-IPC_C]
R115  10M  [FP-CRCW0805-e3-IPC_C]
R116  1k  [FP-MCU0805-IPC_A]
R117  0 ohm  [RESC1608X55X25ML10T15]
R118  10K  [FP-TFCR0805-IPC_C]
R119  DNP  [RESC1608X55X25ML10T15]
U100  AD8232ACPZ-R7  [QFN50P400X400X100-21N]

### Ports
3.3V (see 01_ECG_Input_AFE[1A], 01_ECG_Input_AFE[2A], 01_ECG_Input_AFE[2C], 01_ECG_Input_AFE[3C], 03_ADC_Reference[1B], 03_ADC_Reference[3C], 03_ADC_Reference[3D], 05_Power_Management[4A]), 3.3V (see 01_ECG_Input_AFE[1A], 01_ECG_Input_AFE[2A], 01_ECG_Input_AFE[2C], 01_ECG_Input_AFE[3D], 03_ADC_Reference[1B], 03_ADC_Reference[3C], 03_ADC_Reference[3D], 05_Power_Management[4A]), 3.3V (see 01_ECG_Input_AFE[1A], 01_ECG_Input_AFE[2A], 01_ECG_Input_AFE[3C], 01_ECG_Input_AFE[3D], 03_ADC_Reference[1B], 03_ADC_Reference[3C], 03_ADC_Reference[3D], 05_Power_Management[4A]), 3.3V (see 01_ECG_Input_AFE[1A], 01_ECG_Input_AFE[2C], 01_ECG_Input_AFE[3C], 01_ECG_Input_AFE[3D], 03_ADC_Reference[1B], 03_ADC_Reference[3C], 03_ADC_Reference[3D], 05_Power_Management[4A]), 3.3V (see 01_ECG_Input_AFE[2A], 01_ECG_Input_AFE[2C], 01_ECG_Input_AFE[3C], 01_ECG_Input_AFE[3D], 03_ADC_Reference[1B], 03_ADC_Reference[3C], 03_ADC_Reference[3D], 05_Power_Management[4A]), REFOUT (out, see 03_ADC_Reference[1B]), SIGNAL_OUT (out, see 03_ADC_Reference[1A])

### Nets
GND: C105.2 C106.2 DS100.2(K) R115.1 R117.2 U100.16(GND)
3.3V: C106.1 R100.1 R114.1 R118.1 R119.2 U100.15(FR) U100.17(+VS) ; port 3.3V
REFOUT: C100.2 C101.1 R111.2 U100.8(REFOUT) ; port REFOUT
SIGNAL_OUT: C104.1 R112.1 R116.2 U100.10(OUT) ; port SIGNAL_OUT
NetC100_1: C100.1 R101.2 R102.2 U100.6(SW)
NetC101_2: C101.2 R107.2 U100.7(OPAMP+)
NetC102_1: C102.1 U100.1(HPDRIVE)
NetC102_2: C102.2 R104.1 U100.20(HPSENSE)
NetC103_1: C103.1 R113.2 U100.4(RLDFB)
NetC103_2: C103.2 U100.5(RLD)
NetC104_2: C104.2 R103.1 R107.1
NetC105_1: C105.1 R114.2 R115.2 U100.18(REFIN)
NetDS100_1: DS100.1(A) R116.1
NetJ100_1: J100.1 R106.1 R110.1
NetJ100_2: J100.2 R113.1
NetJ100_3: J100.3 R105.1 R109.1
NetR100_2: R100.2 R101.1 R105.2 R106.2
NetR102_1: R102.1 R104.2 R108.2
NetR103_2: R103.2 R108.1 U100.19(IAOUT)
NetR109_2: R109.2 U100.2(+IN)
NetR110_2: R110.2 U100.3(-IN)
NetR111_1: R111.1 R112.2 U100.9(OPAMP-)
NetR117_1: R117.1 R119.1 U100.14(AC/DC)
NetR118_2: R118.2 U100.13(SDN)

Not connected (* = marked no-connect by the designer): U100 11(LOD-) 12(LOD+)

### Notes on the sheet
- LA
- RA
- RL
- AD8232_Heart_Rate_Analog_Frontend
- Mokshan

### Library data of the parts
C100 C102 = CMP-2007-03570-1: Manufacturer: Murata; Part Number: GRM21BR71E334KA01K
C101 = CMP-04427-005637-1: General Purpose Ceramic Capacitor, 0805, 10nF, 10%, X8R, 15%, 50V; Voltage Rating (DC): 50V; Length: 2.01mm; Case/Package: 0805; REACH SVHC: No SVHC; Series: FlEXITERM; Max Operating Temperature: 150°C; RoHS Compliant: Yes; Termination: SMD/SMT; Tolerance: 10%; Capacitance: 10nF; Voltage: 50V; Height: 0.94mm; Dielectric: X8R; Min Operating Temperature: -55°C; Depth: 1.25mm
C103 = CMP-1036-02962-1: CAP 1nF 16V ±20% 0805 (2012 Metric) Thickness 1mm SMD; Tolerance: Â±20%; Case-Metric: 2012; Case-EIA: 0805; Max Thickness: 1 mm; Technology: SMT; Rated Voltage: 16 V; Value: 1nF
C104 = CMP-2007-04787-1: Part Number: 08055F152KAT2A; Manufacturer: AVX Interconnect / Elco
C105 C106 = CMP-03422-000402-1: CC0805 100 nF X7R 20.00% 16 V; Manufacturer: Yageo; Manufacturer Part Number: CC0805MRX7R7BB104; Voltage Rating: 16 V; Material: Ceramic; Capacitance: 100 nF; Tolerance: 0.2; Value: 100 nF; Temperature: -30°C to +85°C; Category: Cap; ComponentLink2Description: Datasheet; RoHS: TRUE; Footprint Url: http://www.yageo.com/exep/pages/download/literatures/UPY-C_GEN_24.pdf; Lead Free: Yes; Octopart: https://octopart.com/cc0805mrx7r7bb104-yageo-84795387; ComponentLink2URL: http://www.yageo.com/documents/recent/UPY-GPHC_Y5V_6.3V-to-50V_8.pdf; Device Class L2: Capacitors; Ipc Land Pattern Name: CAPC200125X85; Height: 0.95mm; Temperature Range High: +85°C; Device Class L3: Ceramic Capacitors; Temperature Characteristic: X7R; Temperature Range Low: -30°C; Package: CC0805-0.85; Automotive: No; Device Class L1: Passive Components
DS100 = CMP-2000-07123-1: LED Red, 65 mW, -40 to 85 degC, 2-Pin SMD, RoHS, Tape and Reel; Manufacturer: Lumex; Part No: SML-LX1206IC-TR; LED Material: GaAsP; Peak Wavelength: 635nm; Number of LEDs: 1; Viewing Angle: 160; Reverse Voltage: 5(Min)V; Lens Appearance: ColorlessNonDiffused; Intensity: 6mcd; Type: Uni-Color; Pin_Count: 2; Lens Dimensions: 2x1.6x0.5mm; Mounting: SurfaceMount; ECCN: EAR99; RoHS: Unknown; Package Description: 2-Pin Surface Mount Device, Body 3.2 x 1.5 mm; Mounting Technology: SurfaceMount; Dominant Wavelength: N/A; Supplier_Package: SMD; Supplier Standard Pack: 3,000; Color: Red; Dimension: 3.2x1.6x1.1mm; HTS: 8541402000; Family: SML-LX1206IC; Supplier: Lumex; Datasheet URL: http://www.lumex.com/content/files/ProductAttachment/SML-LX1206IC-TR.pdf; Package Reference: SML-LX1206IC; Manufacturer URL: http://www.lumexinstruments.com/; Operating Temperature: -25to85C; Packaging: TapeandReel; Datasheet Version: Rev. J, 08/2012
J100 = SJ1-3523N: 3.5 mm, Stereo, Right Angle, Through Hole, 3 Conductors, 0 Internal Switches, Audio Jack Connector; MF: Same Sky; SnapEDA_Link: https://www.snapeda.com/parts/SJ1-3523N/Same+Sky/view-part/?ref=snap; Package: None; Value: *; MP: SJ1-3523N; Check_prices: https://www.snapeda.com/parts/SJ1-3523N/Same+Sky/view-part/?ref=eda
R100 R101 R117 R119 = CMP-2100-03667-1: Chip Resistor, 0 Ohm, +/- 5%, 0.1 W, -55 to 155 degC, 0603 (1608 Metric), RoHS, Tape and Reel; Manufacturer: Yageo; Temperature Coefficient: 200ppm/degreesC; Voltage Rating: 50V; Power Rating: 100mW; Resistance: 0mOhm; Width: 0.8mm; Max Operating Temperature: 155degC; Tolerance: 5%; Package Reference: 0603; Height: 0.45mm; Depth: 0.8mm; Package Description: 2-Pin Surface Mount Device, Body 1.6 x 0.8 mm; Termination: SMD/SMT; Package Quantity: 5000; Case/Package: 0603; Case Code (Imperial): 0603; Radiation Hardening: No; Number of Pins: 2; Length: 1.6mm; Lead Free: LeadFree; Voltage Rating (DC): 50V; Military Standard: Not; Datasheet URL: http://www.yageo.com/NewPortal/yageodocoutput?fileName=/pdf/R-Chip/PYu-RC_Group_51_RoHS_L_5.pdf; Manufacturer URL: http://www.yageo.com/; Packaging: TapeandReel; Case Code (Metric): 1608; Min Operating Temperature: -55degC; Composition: ThickFilm; RoHSCompliant: true; Contact Plating: Tin; Datasheet Version: Rev. 5, 10/2016; REACH SVHC: NoSVHC
R102 = CMP-08839-004808-1: 1.4MΩ ±1% 0.4W 0805 Anti-Surge Chip Resistor AEC-Q200; Temperature Coefficient: 100ppm/°C; Resistance: 1.4MR; Max Power Dissipation: 400mW; Resistor Type: Thick Film; Width: 0.049inch; Min Operating Temperature: -55°C; Max Operating Temperature: 155°C; Height: 0.026inch; Length: 0.079inch; Package Quantity: 5000; Packaging: Tape and Reel; Features: Automotive AEC-Q200; RoHS Compliant: Yes; Number of Terminations: 2; Case/Package: 0805; Series: ESR10; Tolerance: 1%
R103 R107 R112 = CMP-1013-00146-1: 1M 0.125W 5% 0805 (2012 Metric)  SMD; Case-Metric: 2012; Value: 1000000.00 Ohm; Case-EIA: 0805; Technology: SMT; Tolerance: 5 %; Power: 0.125 W
R104-R106 R108 R114 R115 = CMP-2001-04913-2: RES Thick Film, 10MΩ, 1%, 0.125W, 100ppm/°C, 0805; Power Rating: 125mW; Voltage Rating (DC): 150V; Tolerance: 5%; Resistance: 10MR; Contact Plating: Tin; Composition: Thick Film; Length: 2mm; Weight: 0.000194oz; Case Code (Metric): 2012; Voltage Rating: 150V; Package Quantity: 10; Height: 0.02inch; Case Code (Imperial): 0805; Lead Free: Lead Free; Depth: 1.25mm; Min Operating Temperature: -55°C; Max Power Dissipation: 125mW; Temperature Coefficient: 100ppm/°C; Mount: Surface Mount; Features: Automotive AEC-Q200; Termination: SMD/SMT; Max Operating Temperature: 155°C; Radiation Hardening: No; Case/Package: 0805; Width: 0.049inch; Military Standard: Not; Number of Terminations: 2; Packaging: Tape and Reel
R109 R110 R113 = CMP-2001-04645-1: Manufacturer: KOA Speer; Part Number: RK73B2ATTD364J
R111 = CMP-03211-000816-1: CRGCQ 0805 100K 1%; Manufacturer: TE Connectivity; Manufacturer Part Number: CRGCQ0805F100K; Tolerance: 0.01; Power Rating: 0.125W; Resistance: 100KΩ; Value: 100KΩ; Temperature Coefficient: ±100ppm/°C; Voltage Rating: 150V; RoHS: TRUE; ComponentLink2URL: https://www.te.com/commerce/DocumentDelivery/DDEController?Action=showdoc&DocId=Data+Sheet%7F1773204-3%7F1%7Fpdf%7FEnglish%7FENG_DS_1773204-3_1.pdf%7F4-2176341-1150; Category: Res; Device Class L2: Resistors; Height: 0.65mm; Ambient Temperature Range High: +70°C; Ipc Land Pattern Name: RESC200125X55; Octopart: https://octopart.com/crgcq0805f100k-te+connectivity-91018138; Digikey Description: CRGCQ 0805 100K 1%; Temperature Range High: +155°C; Lead Free: Yes; Automotive: Yes; Temperature Range Low: -55°C; Device Class L1: Passive Components; Device Class L3: Chip SMD Resistors; Mouser Description: Res Thick Film 0805 100K Ohm 1% 0.125W(1/8W) ±100ppm/C Pad SMD Automotive T/R; Temperature: -55°C to +155°C; Composition: Thick Film; ComponentLink2Description: Datasheet; Automotive Grade: Grade 1141; Package: CRGCQ0805; Series: CRGCQ
R116 = CMP-02407-009864-1: RES 1.05K OHM 0.5% 1/5W 0805; Voltage Rating (DC): 100V; Temperature Coefficient: 25ppm/°C; Max Power Dissipation: 125mW; Resistance: 1kR; Tolerance: 0.1%; Radiation Hardening: No; Composition: Thin Film; Height: 0.022inch; Package Quantity: 1000; Length: 0.079inch; Width: 0.049inch; Case/Package: 0805; Number of Terminations: 2; Packaging: Tape and Reel; Depth: 1.25mm; Contact Plating: Tin; Military Standard: Not; Lead Free: Lead Free; Max Operating Temperature: 125°C; Min Operating Temperature: -55°C
R118 = CMP-250906-233618-1: RES Thin Film,  2kΩ, 0.1%, 0.1W, 25ppm/°C, 0805
U100 = AD8232ACPZ-R7: None; MF: {'manufacturer': u'Analog Devices Inc.'}; Package: None; Price: None; Value: *; MP: AD8232ACPZ-R7; Availability: Unavailable

## Nets that join several sheets
GND: 03_ADC_Reference (14 pins), 04_MCU_BLE (10 pins), 05_Power_Management (18 pins), 01_ECG_Input_AFE (6 pins)
3.3V: 03_ADC_Reference (6 pins), 05_Power_Management (C505.2 U503.5), 01_ECG_Input_AFE (7 pins)
ADC_CS: 03_ADC_Reference (R303.1 U301.2), 04_MCU_BLE (U401.30)
ADC_DRDY: 03_ADC_Reference (U301.14), 04_MCU_BLE (U401.31)
DVDD_3V3: 03_ADC_Reference (C304.1 C305.1 R303.2 U301.13), 04_MCU_BLE (6 pins), 05_Power_Management (C507.1 U504.5)
REFOUT: 03_ADC_Reference (R302.1), 01_ECG_Input_AFE (C100.2 C101.1 R111.2 U100.8)
SIGNAL_OUT: 03_ADC_Reference (R301.1), 01_ECG_Input_AFE (C104.1 R112.1 R116.2 U100.10)
SPI_MISO: 03_ADC_Reference (U301.15), 04_MCU_BLE (U401.27)
SPI_MOSI: 03_ADC_Reference (U301.16), 04_MCU_BLE (U401.26)
SPI_SCK: 03_ADC_Reference (U301.1), 04_MCU_BLE (U401.25)